# Altium schematic sheet Imu.SchDoc
size 420 x 297 mm; SheetNumber: 3; SheetTotal: 8
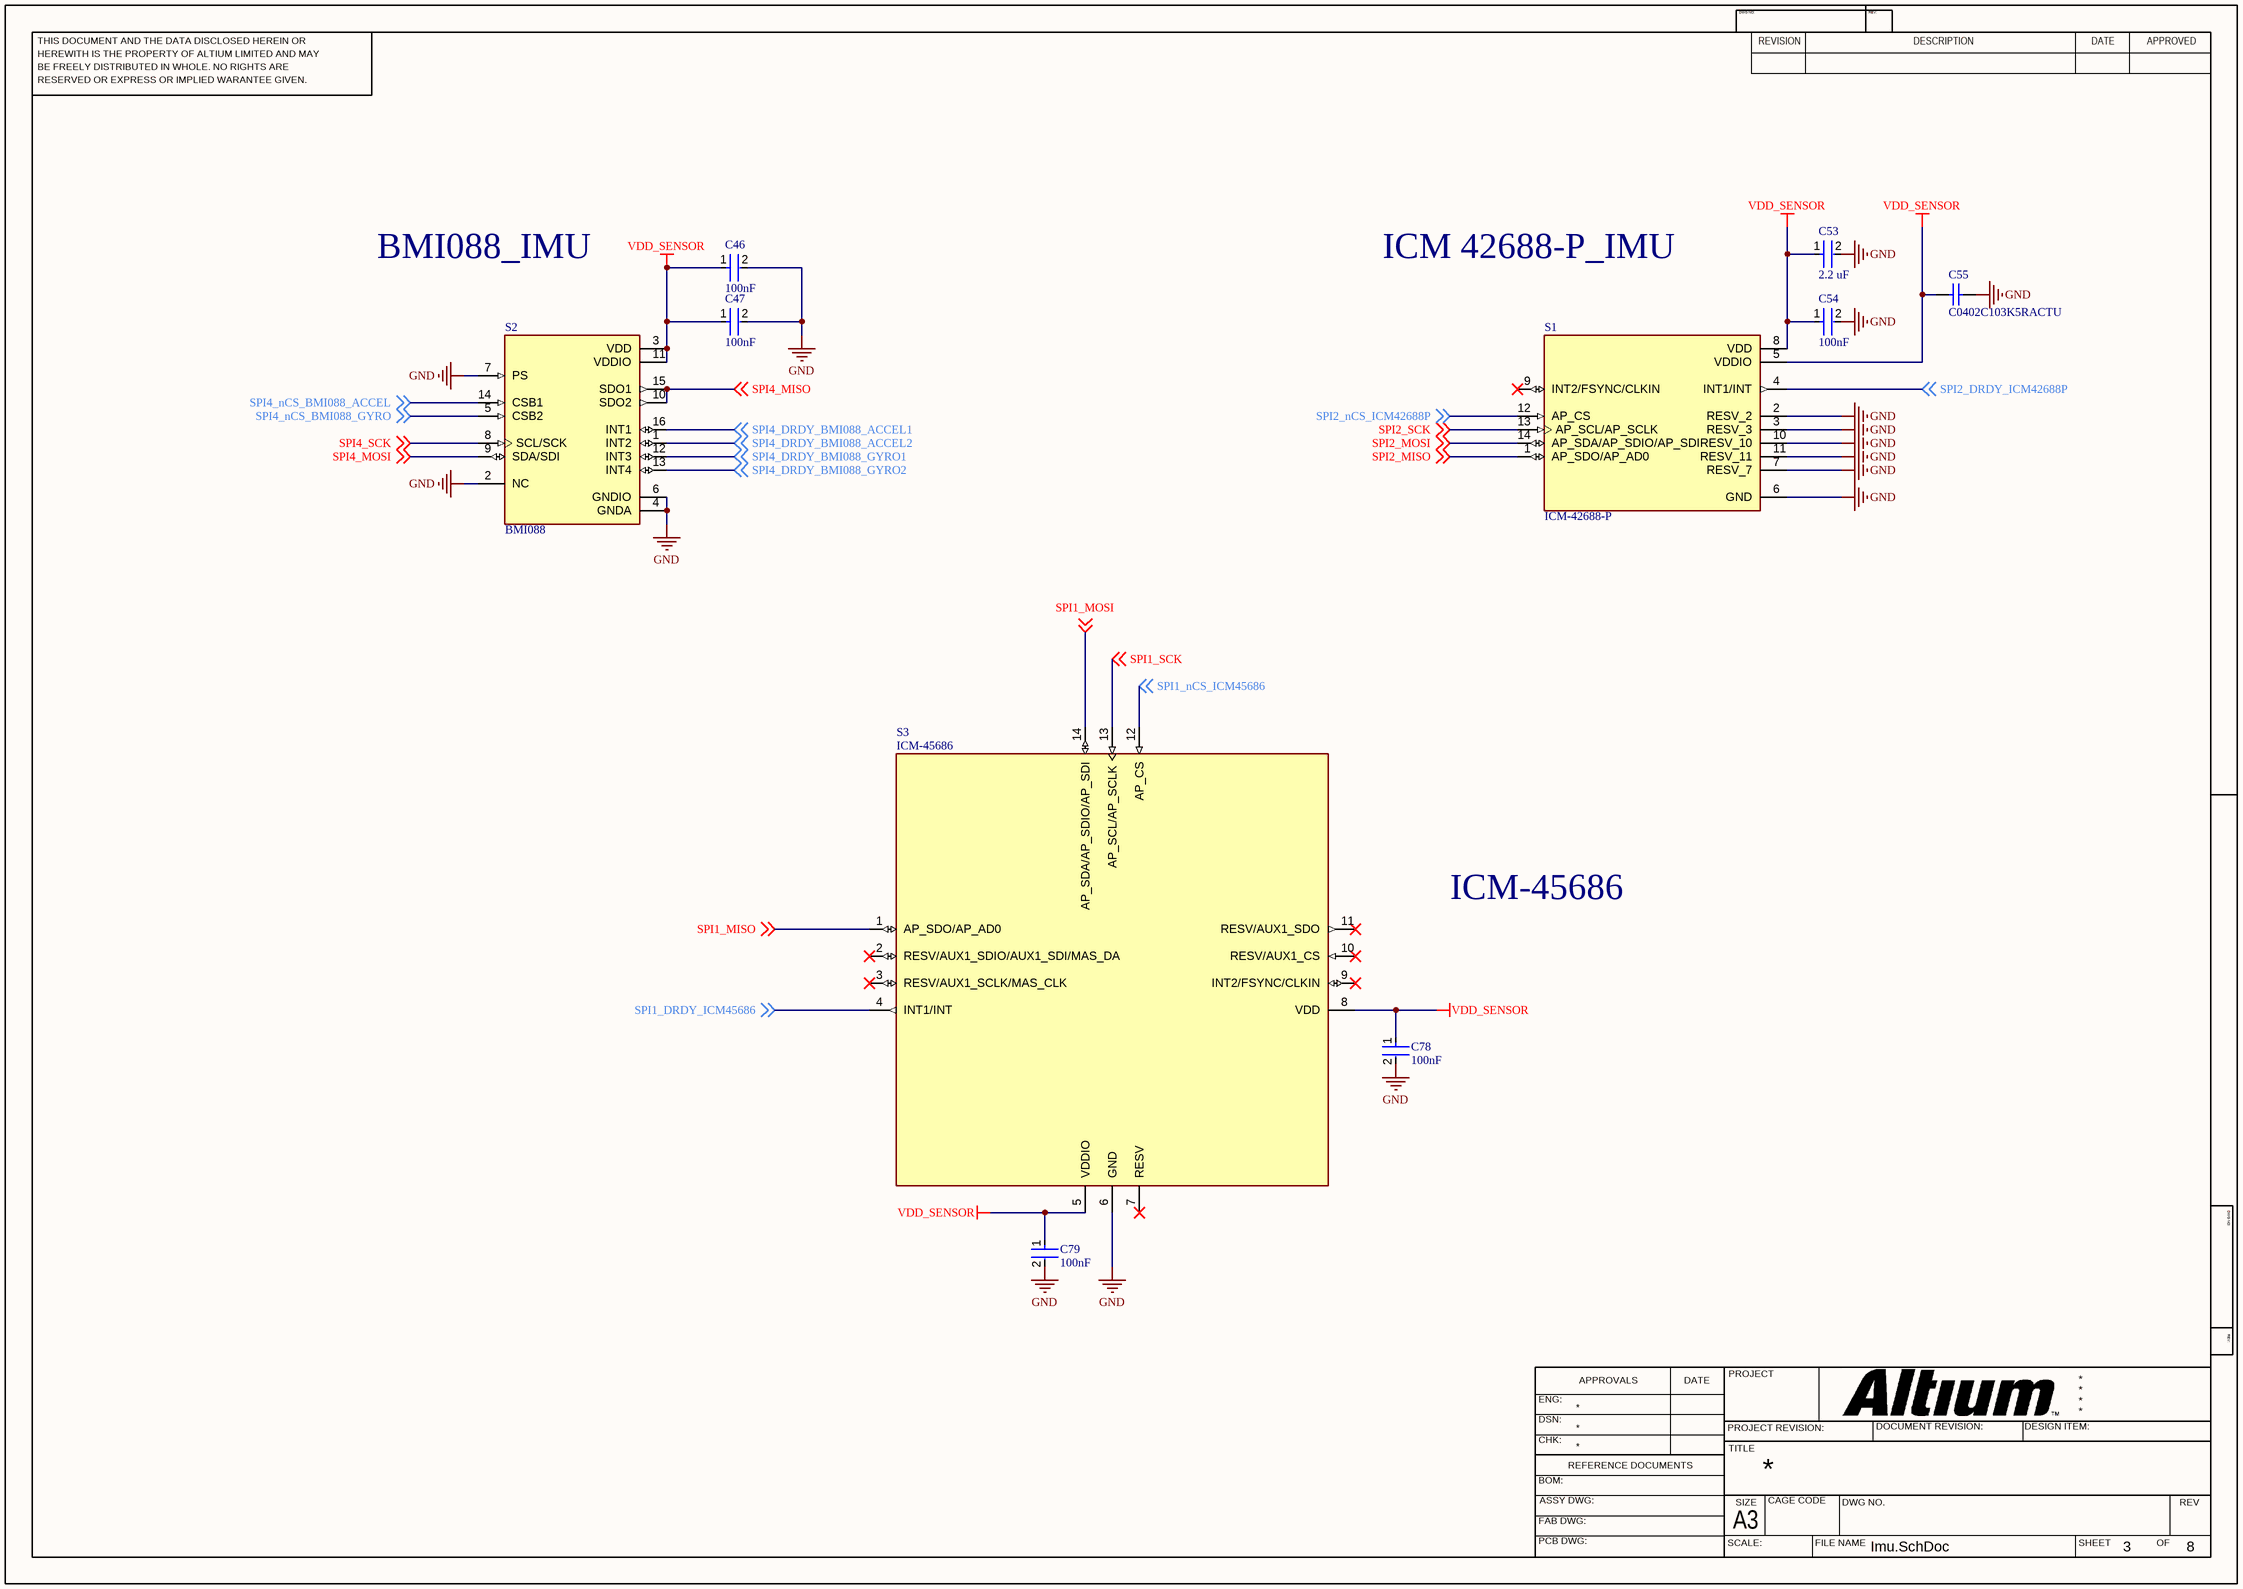
[diagram p0: Imu.SchDoc]

## Parts
C46  100nF  [FP-CC0402-MFG]
C47  100nF  [FP-CC0402-MFG]
C53  2.2 uF  [FP-C1005-050-IPC_A]
C54  100nF  [FP-CC0402-MFG]
C55  C0402C103K5RACTU  [CAPC1005X55X30LL05T10]
C78  100nF  [FP-CC0402-MFG]
C79  100nF  [FP-CC0402-MFG]
S1  ICM-42688-P  [PQFN50P300X250X97-14N]
S2  BMI088  [PQFN50P450X300X100-16N]
S3  ICM-45686  [IC_ICM-45686]

## Nets
GND: C46.2 C47.2 C53.2 C54.2 C55.2 C78.2 C79.2 S1.2(RESV_2) S1.3(RESV_3) S1.6(GND) S1.7(RESV_7) S1.10(RESV_10) S1.11(RESV_11) S2.2(NC) S2.4(GNDA) S2.6(GNDIO) S2.7(PS) S3.6(GND)
VDD_SENSOR: C46.1 C47.1 C53.1 C54.1 C55.1 C78.1 C79.1 S1.5(VDDIO) S1.8(VDD) S2.3(VDD) S2.11(VDDIO) S3.5(VDDIO) S3.8(VDD)
SPI1_DRDY_ICM45686: S3.4(INT1/INT) ; off-sheet SPI1_DRDY_ICM45686
SPI1_MISO: S3.1(AP_SDO/AP_AD0) ; off-sheet SPI1_MISO
SPI1_MOSI: S3.14(AP_SDA/AP_SDIO/AP_SDI) ; off-sheet SPI1_MOSI
SPI1_nCS_ICM45686: S3.12(AP_CS) ; off-sheet SPI1_nCS_ICM45686
SPI1_SCK: S3.13(AP_SCL/AP_SCLK) ; off-sheet SPI1_SCK
SPI2_DRDY_ICM42688P: S1.4(INT1/INT) ; off-sheet SPI2_DRDY_ICM42688P
SPI2_MISO: S1.1(AP_SDO/AP_AD0) ; off-sheet SPI2_MISO
SPI2_MOSI: S1.14(AP_SDA/AP_SDIO/AP_SDI) ; off-sheet SPI2_MOSI
SPI2_nCS_ICM42688P: S1.12(AP_CS) ; off-sheet SPI2_nCS_ICM42688P
SPI2_SCK: S1.13(AP_SCL/AP_SCLK) ; off-sheet SPI2_SCK
SPI4_DRDY_BMI088_ACCEL1: S2.16(INT1) ; off-sheet SPI4_DRDY_BMI088_ACCEL1
SPI4_DRDY_BMI088_ACCEL2: S2.1(INT2) ; off-sheet SPI4_DRDY_BMI088_ACCEL2
SPI4_DRDY_BMI088_GYRO1: S2.12(INT3) ; off-sheet SPI4_DRDY_BMI088_GYRO1
SPI4_DRDY_BMI088_GYRO2: S2.13(INT4) ; off-sheet SPI4_DRDY_BMI088_GYRO2
SPI4_MISO: S2.10(SDO2) S2.15(SDO1) ; off-sheet SPI4_MISO
SPI4_MOSI: S2.9(SDA/SDI) ; off-sheet SPI4_MOSI
SPI4_nCS_BMI088_ACCEL: S2.14(CSB1) ; off-sheet SPI4_nCS_BMI088_ACCEL
SPI4_nCS_BMI088_GYRO: S2.5(CSB2) ; off-sheet SPI4_nCS_BMI088_GYRO
SPI4_SCK: S2.8(SCL/SCK) ; off-sheet SPI4_SCK

Not connected (* = marked no-connect by the designer): S1 9(INT2/FSYNC/CLKIN)*; S3 2(RESV/AUX1_SDIO/AUX1_SDI/MAS_DA)* 3(RESV/AUX1_SCLK/MAS_CLK)* 7(RESV)* 9(INT2/FSYNC/CLKIN)* 10(RESV/AUX1_CS)* 11(RESV/AUX1_SDO)*

## Notes on the sheet
- BMI088_IMU
- ICM 42688-P_IMU
- ICM-45686
- THIS DOCUMENT AND THE DATA DISCLOSED HEREIN OR
- HEREWITH IS THE PROPERTY OF ALTIUM LIMITED AND MAY
- DWG NO:
- REVISION
- REV:
- DESCRIPTION
- DATE
- APPROVED
- BE FREELY DISTRIBUTED IN WHOLE. NO RIGHTS ARE
- RESERVED OR EXPRESS OR IMPLIED WARANTEE GIVEN.
- ENG:
- APPROVALS
- PROJECT
- DSN:
- CHK:
- REFERENCE DOCUMENTS
- PROJECT REVISION:
- TITLE
- DOCUMENT REVISION:
- DESIGN ITEM:
- BOM:
- FAB DWG:
- PCB DWG:
- ASSY DWG:
- SCALE:
- A3
- SIZE
- CAGE CODE
- FILE NAME
- DWG NO.
- SHEET
- OF
- REV

## Library data of the parts
C46 C47 C54 C78 C79 = CMP-03422-001121-1: CAP CER 0.1UF 16V X7R 0402; Manufacturer: YAGEO; Manufacturer Part Number: CC0402KPX7R7BB104; Material: Ceramic; Temperature Coefficient: 30ppm/°C; Automotive Grade: NA; Tolerance: 0.1; Digikey Description: CAP CER 0.1UF 16V X7R 0402; Temperature Range Low: -55°C; Footprint Url: http://www.yageo.com/exep/pages/download/literatures/UPY-C_GEN_24.pdf; RoHS: TRUE; Device Class L3: Ceramic Capacitors; Temperature Characteristic: X7R; Capacitance: 100 nF; Package: CC0402; Device Class L1: Passive Components; Lead Free: Yes; Temperature Range High: +125°C; Category: Cap; Mouser Description: 0402 0.1 uF 16 V ±10% Tolerance X7R SMT Multilayer Ceramic Capacitor; Voltage Rating: 16 V; Value: 100 nF; ComponentLink2Description: Datasheet; Automotive: No; Octopart: https://octopart.com/cc0402kpx7r7bb104-yageo-21548559; ComponentLink2URL: http://www.yageo.com/documents/recent/UPY-GP_NP0_16V-to-50V_16.pdf; Height: 0.55mm; Device Class L2: Capacitors; Temperature: -55°C to +125°C; Ipc Land Pattern Name: CAPC10050X50
C53 = CMP-08246-004339-1: CAP CER 2.2UF 25V X5R 0402; Dielectric Material: Ceramic; Tolerance: 10%; REACH SVHC: No SVHC; Weight: 2.3E-05oz; Capacitance: 2.2uF; Length: 1mm; RoHS Compliant: Yes; Package Quantity: 1; Voltage Rating (DC): 25V; Dielectric: X5R; Series: C; Voltage Rating: 25V; Case Code (Imperial): 0402; Min Operating Temperature: -55°C; Depth: 0.5mm; Resistor Type: Ceramic; Height: 0.5mm; Width: 0.5mm; Mount: Surface Mount; Case Code (Metric): 1005; Case/Package: 0402; Max Operating Temperature: 85°C; Thickness: 0.022inch; Lead Free: Lead Free; Termination: SMD/SMT; Packaging: Tape and Reel
C55 = CMP-1034-01886-2: Manufacturer: Kemet; Part Number: C0402C103K5RACTU
S1 = CMP-010-00026-1: Accelerometer, Gyroscope, 6 Axis Sensor Output; MP: ICM-42688-P; Source: ICM-42688-P.SchLib; Pins: 14; Availability: Unavailable; Price: None; Value: *; Component Type: Standard; Design Item ID: ICM-42688-P; Case/Package: None
S2 = CMP-010-00024-1: High-performance 6-axis inertial sensor (accelerometer + gyroscope) <a href="https://pricing.snapeda.com/parts/BMI088/Bosch%20Sensortec/view-part?ref=eda">Check prices</a>; Design Item ID: BMI088; Source: BMI088.SchLib; Case/Package: None; Value: *; Availability: Unavailable; Component Type: Standard; Pins: 16; Price: None; MP: BMI088
S3 = CMP-010-00025-1: Accelerometer, Gyroscope, 6 Axis Sensor I2C, I3C, SPI Output; MF: TDK InvenSense; Design Item ID: ICM-45686; Component Type: Standard; Check_prices: https://www.snapeda.com/parts/ICM-45686/TDK+InvenSense/view-part/?ref=eda; Case/Package: Package; SnapEDA_Link: https://www.snapeda.com/parts/ICM-45686/TDK+InvenSense/view-part/?ref=snap; Pins: 14; Source: ICM-45686.SchLib; MP: ICM-45686; Value: *